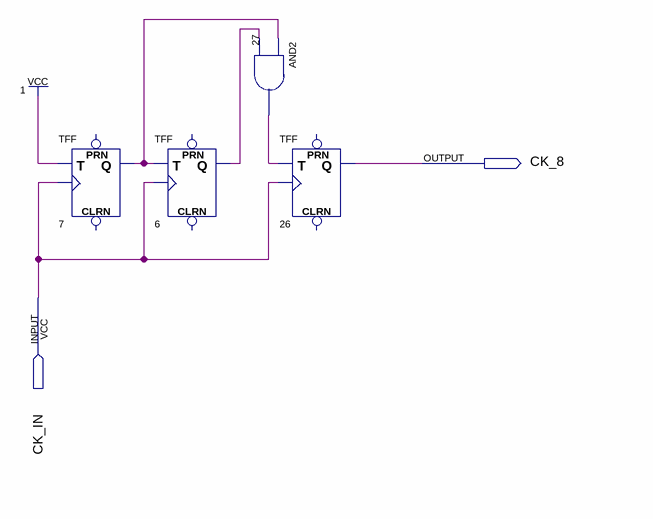
[diagram p0: schematic sheet]
// Quartus schematic div_8.bdf as structural Verilog: 4 symbols, 2 pins
module div_8 (
  input  CK_IN,
  output CK_8
);

  wire n6_q, n7_q, n27_out;

  TFF u_7 (.T(1'b1), .CLK(CK_IN), .Q(n7_q));  // open: PRN, CLRN
  TFF u_6 (.T(n7_q), .CLK(CK_IN), .Q(n6_q));  // open: PRN, CLRN
  and u_27 (n27_out, n7_q, n6_q);
  TFF u_26 (.T(n27_out), .CLK(CK_IN), .Q(CK_8));  // open: PRN, CLRN
endmodule
